# Altium schematic sheet 22_Radar_bypass.SchDoc
size 289 x 396 mm
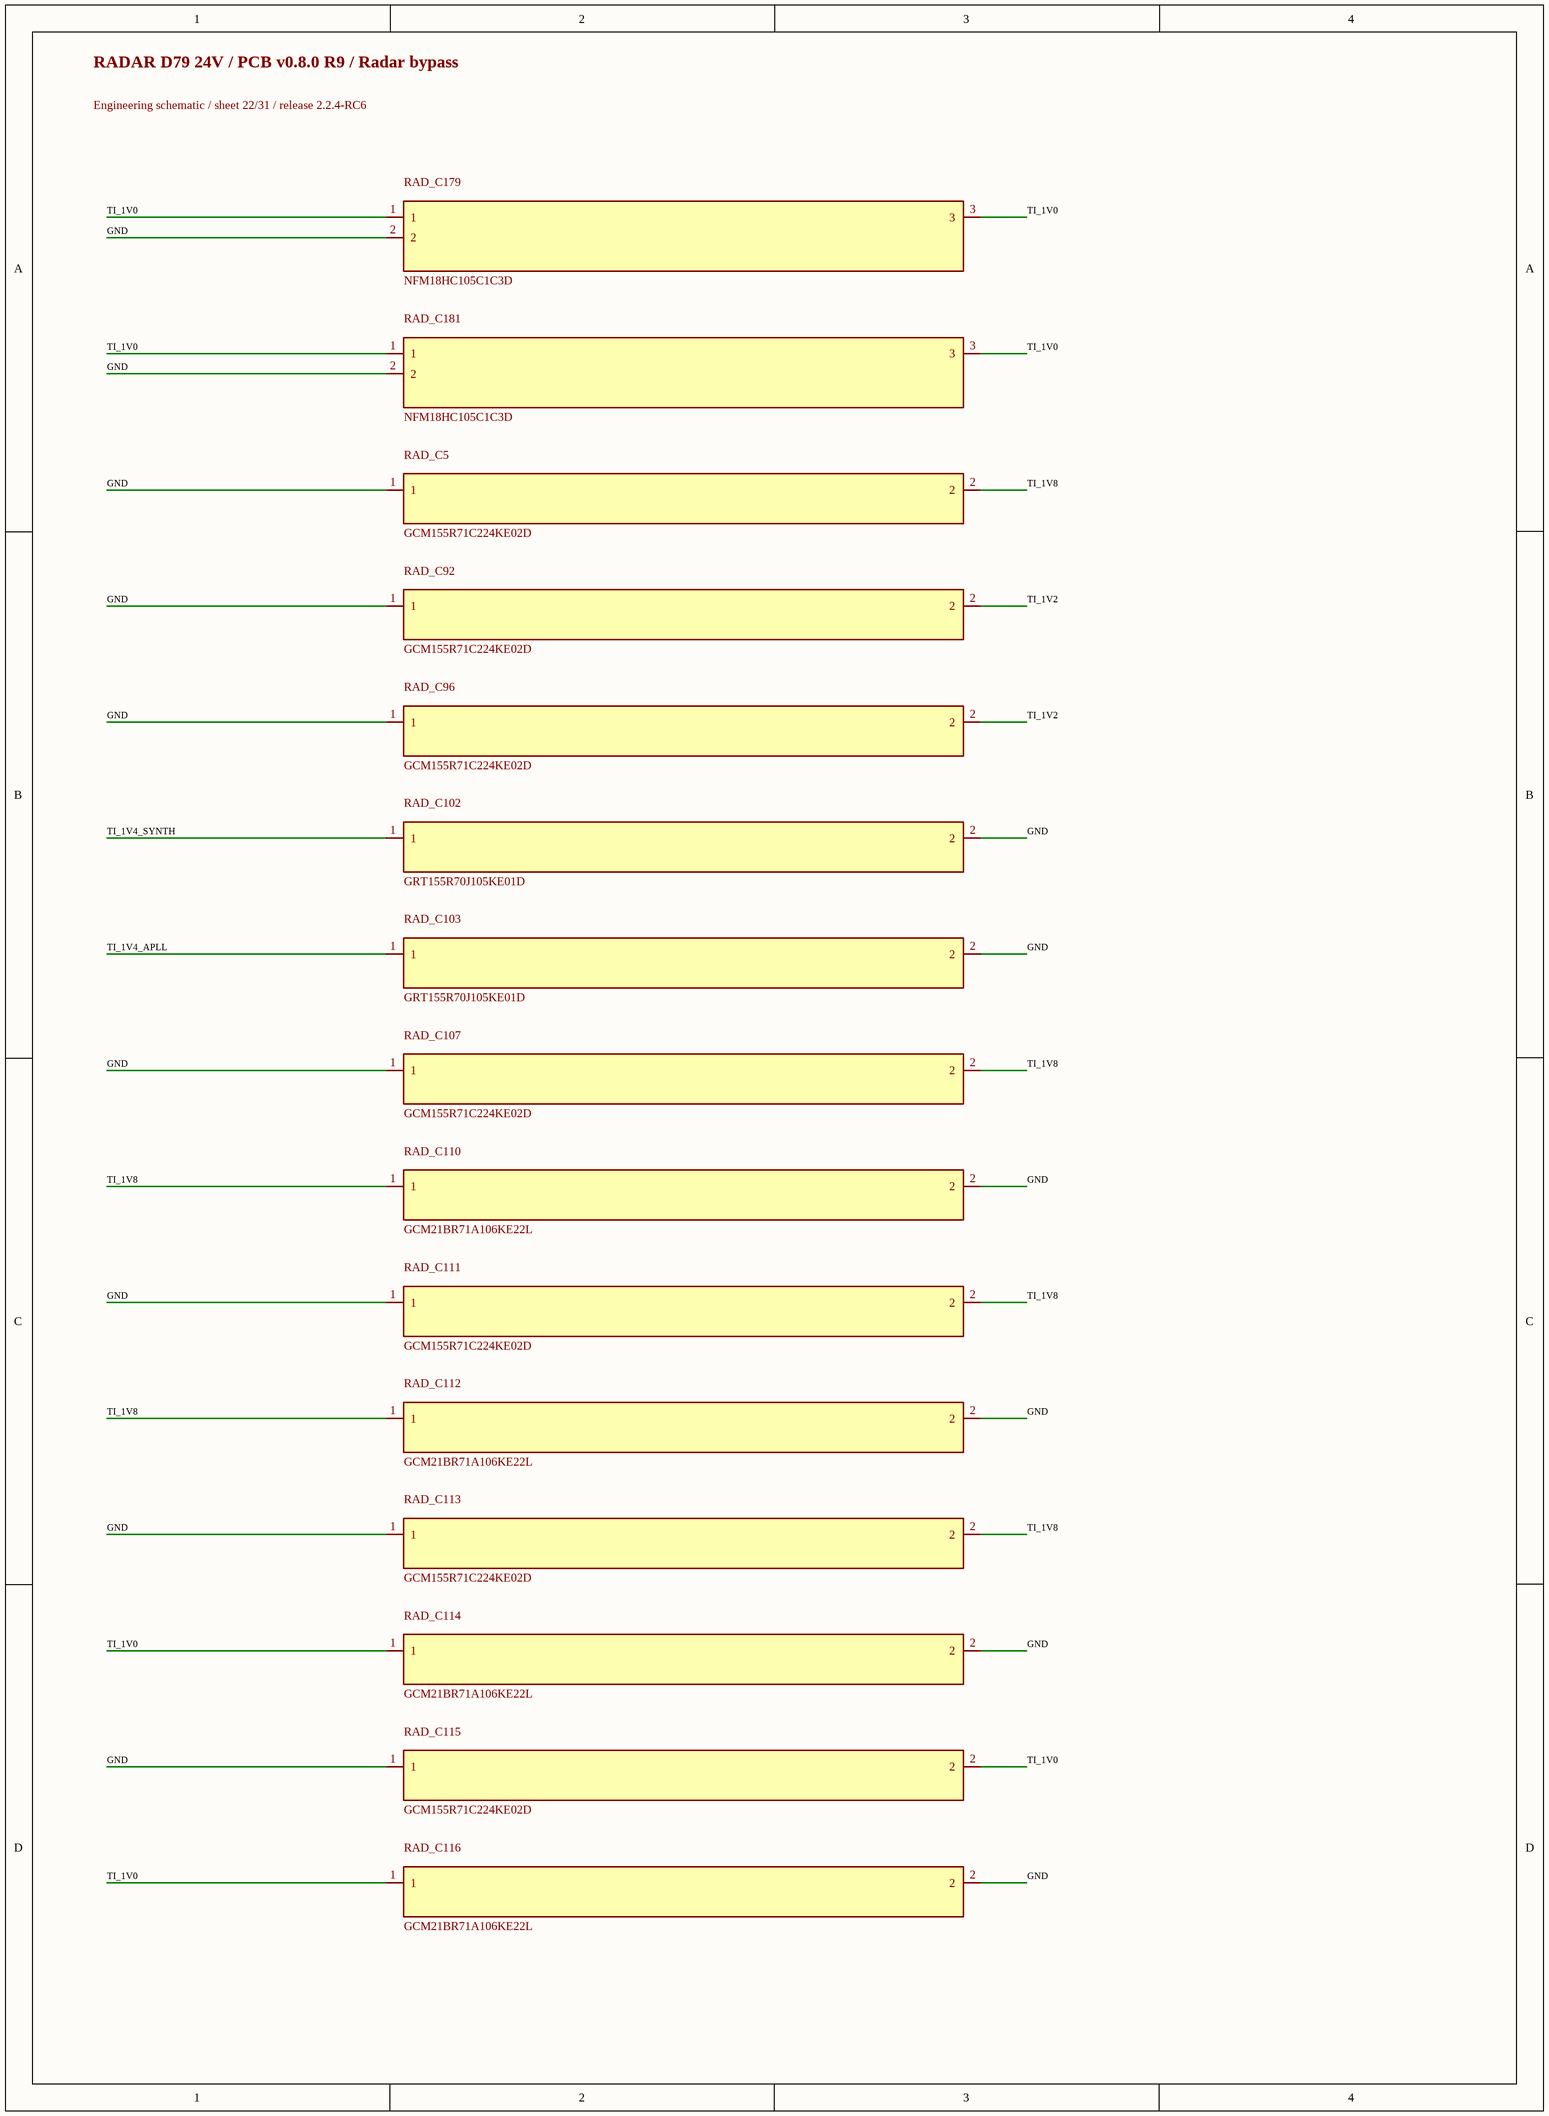
[diagram p0: 22_Radar_bypass.SchDoc]

## Parts
RAD_C5  GCM155R71C224KE02D  [0402L]
RAD_C92  GCM155R71C224KE02D  [0402L]
RAD_C96  GCM155R71C224KE02D  [0402L]
RAD_C102  GRT155R70J105KE01D  [FP-GRT155R70J105KE01D_0402-MFG]
RAD_C103  GRT155R70J105KE01D  [FP-GRT155R70J105KE01D_0402-MFG]
RAD_C107  GCM155R71C224KE02D  [0402L]
RAD_C110  GCM21BR71A106KE22L  [0805L]
RAD_C111  GCM155R71C224KE02D  [0402L]
RAD_C112  GCM21BR71A106KE22L  [0805L]
RAD_C113  GCM155R71C224KE02D  [0402L]
RAD_C114  GCM21BR71A106KE22L  [0805L]
RAD_C115  GCM155R71C224KE02D  [0402L]
RAD_C116  GCM21BR71A106KE22L  [0805L]
RAD_C179  NFM18HC105C1C3D  [FP-NFM18HC105C1C3D_0603-MFG]
RAD_C181  NFM18HC105C1C3D  [FP-NFM18HC105C1C3D_0603-MFG]

## Nets
GND: RAD_C5.1 RAD_C92.1 RAD_C96.1 RAD_C102.2 RAD_C103.2 RAD_C107.1 RAD_C110.2 RAD_C111.1 RAD_C112.2 RAD_C113.1 RAD_C114.2 RAD_C115.1 RAD_C116.2 RAD_C179.2 RAD_C181.2
TI_1V0: RAD_C114.1 RAD_C115.2 RAD_C116.1 RAD_C179.1 RAD_C179.3 RAD_C181.1 RAD_C181.3
TI_1V2: RAD_C92.2 RAD_C96.2
TI_1V4_APLL: RAD_C103.1
TI_1V4_SYNTH: RAD_C102.1
TI_1V8: RAD_C5.2 RAD_C107.2 RAD_C110.1 RAD_C111.2 RAD_C112.1 RAD_C113.2

## Notes on the sheet
- RADAR D79 24V / PCB v0.8.0 R9 / Radar bypass
- Engineering schematic / sheet 22/31 / release 2.2.4-RC6